# Altium schematic sheet power.SchDoc
size A4; SheetNumber: 3; SheetTotal: 15
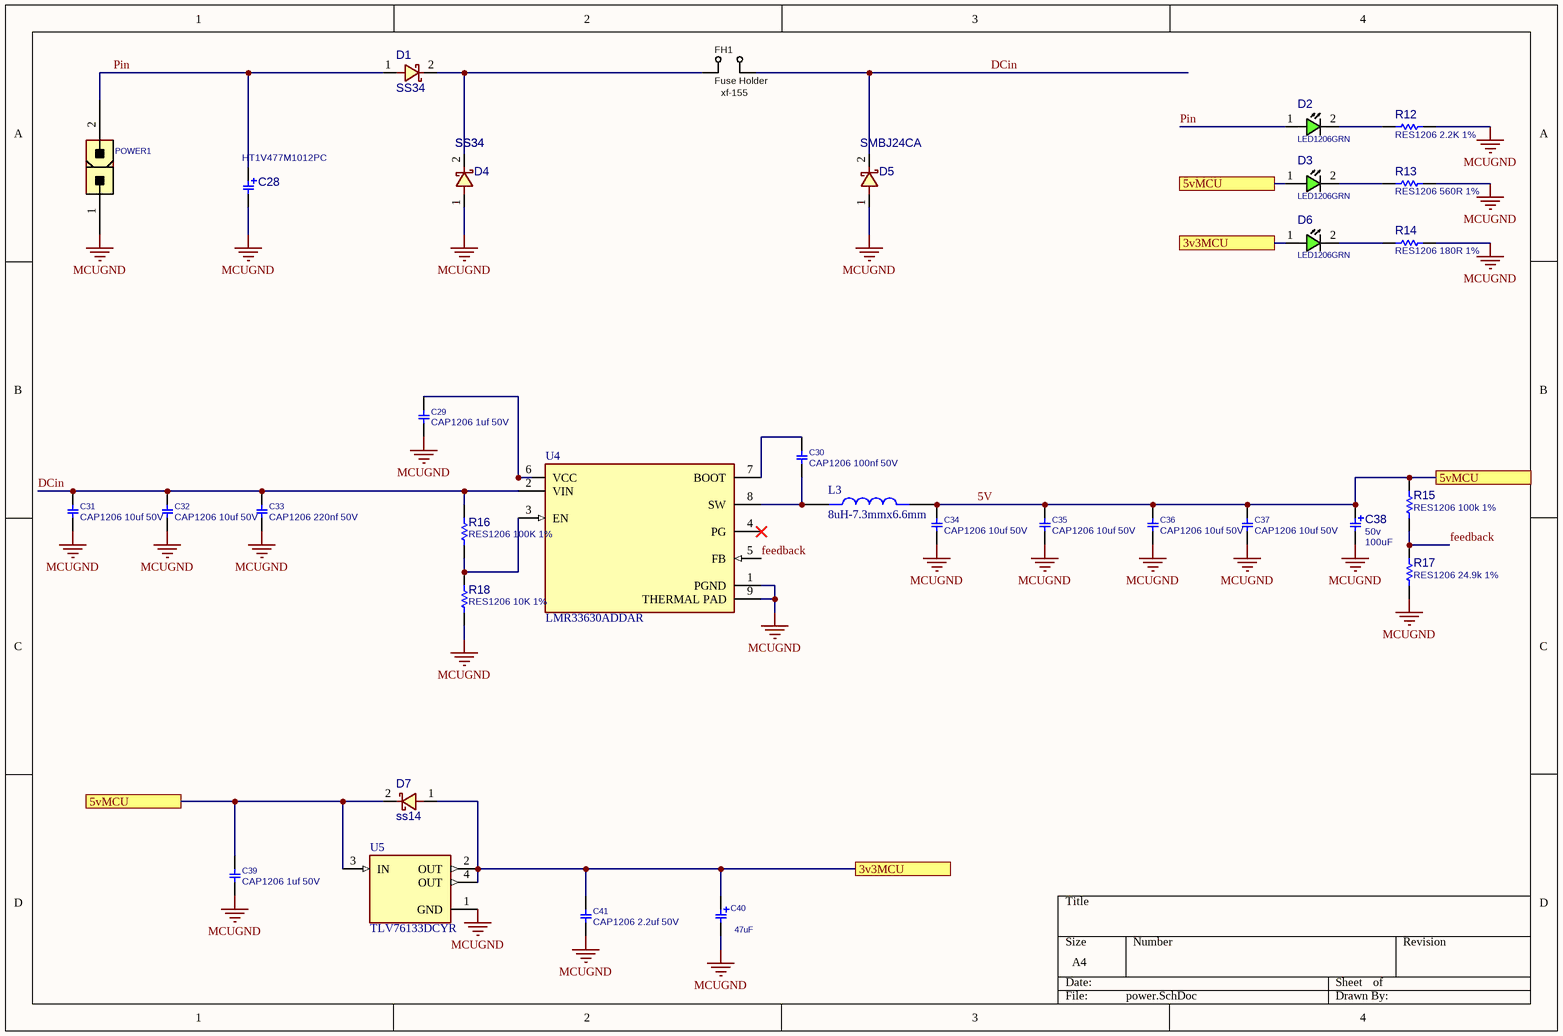
[diagram p0: power.SchDoc]

## Parts
C28  HT1V477M1012PC  [C_EL_10X16]
C29  CAP1206 1uf 50V  [C1206]
C30  CAP1206 100nf 50V  [C1206]
C31  CAP1206 10uf 50V  [C1206]
C32  CAP1206 10uf 50V  [C1206]
C33  CAP1206 220nf 50V  [C1206]
C34  CAP1206 10uf 50V  [C1206]
C35  CAP1206 10uf 50V  [C1206]
C36  CAP1206 10uf 50V  [C1206]
C37  CAP1206 10uf 50V  [C1206]
C38  PARAM2: 50v  [C_EL_8X12]  (hidden comment: 100uF)
C39  CAP1206 1uf 50V  [C1206]
C40  47uF  [C_TN_3528]
C41  CAP1206 2.2uf 50V  [C1206]
D1  SS34  [D_SMB]
D2  LED1206GRN  [LED1206GRN]
D3  LED1206GRN  [LED1206GRN]
D4  SS34  [D_SMB]
D5  SMBJ24CA  [D_SMB]
D6  LED1206GRN  [LED1206GRN]
D7  ss14  [D_SMA]
FH1  xf-155  value Fuse Holder  [FH_24101812]
L3  8uH-7.3mmx6.6mm  [IND_AMPLA7050S-100MT]
POWER1  CONN_ATXPWR_2  [ATXPWR_2]  (value not drawn)
R12  RES1206 2.2K 1%  [R1206]
R13  RES1206 560R 1%  [R1206]
R14  RES1206 180R 1%  [R1206]
R15  RES1206 100k 1%  [R1206]
R16  RES1206 100K 1%  [R1206]
R17  RES1206 24.9k 1%  [R1206]
R18  RES1206 10K 1%  [R1206]
U4  LMR33630ADDAR  [FP-DDA0008J-IPC_C]
U5  TLV76133DCYR  [VREG_TLV76133DCYR]

## Ports
3v3MCU, 5vMCU

## Nets
MCUGND: C28.2 C29.2 C31.2 C32.2 C33.2 C34.2 C35.2 C36.2 C37.2 C38.2 C39.2 C40.2 C41.2 D4.1 D5.1 POWER1.1 R12.1 R13.1 R14.1 R17.1 R18.2 U4.1(PGND) U4.9(THERMAL_PAD) U5.1(GND)
3v3MCU: C40.1 C41.1 D6.1(ANODE) D7.1 U5.2(OUT) U5.4(OUT) ; port 3v3MCU
5V: C34.1 C35.1 C36.1 C37.1 C38.1 C39.1 D3.1(ANODE) D7.2 L3.2 R15.2 U5.3(IN) ; port 5vMCU
DCin: C31.1 C32.1 C33.1 D5.2 FH1.2 R16.1 U4.2(VIN)
feedback: R15.1 R17.2 U4.5(FB)
Pin: C28.1 D1.1 D2.1(ANODE) POWER1.2
NetC29_1: C29.1 U4.6(VCC)
NetC30_1: C30.1 U4.7(BOOT)
NetC30_2: C30.2 L3.1 U4.8(SW)
NetD1_2: D1.2 D4.2 FH1.1
NetD2_2: D2.2(CATHODE) R12.2
NetD3_2: D3.2(CATHODE) R13.2
NetD6_2: D6.2(CATHODE) R14.2
NetR16_2: R16.2 R18.1 U4.3(EN)

Not connected (* = marked no-connect by the designer): U4 4(PG)*

## Library data of the parts
C28 = CAP_THD_EL_470uF_35v: CAP, THD, ELEC,; MANF_P#: MANF_PART#; DESC: DESCRIPTION; DIST#: MOUSER; PARAM: 20%; PARAM2: 35v; VALUE: 470uF; PRICE: 10= -$; MANF: MANF; ASSEMBLY: ASSEMBLY
C29-C37 C39 C41 = CAP_SMD_MLCC_1206: CAP, MLCC; PARAM: -, -%; MANF_P#: MANF_PART#; PARAM2: -V; PRICE: 100= 1$; MANF: -; ASSEMBLY: ASSEMBLY
C38 = CAP_THD_EL_100uF_50v: CAP, THD, ELEC,; MANF_P#: MANF_PART#; DESC: DESCRIPTION; DIST#: MOUSER; PARAM: 20%; PRICE: 10= -$; MANF: MANF; ASSEMBLY: ASSEMBLY; VALUE: 100uF
C40 = CAP_SMD_TAN: CAP, SMD, TAN; PARAM: 20%, 300mOhm, -55~105oC; MANF: VISHAY; MANF_P#: T55A106M6R3C0300; PARAM2: 6.3V; PRICE: 0.46$; VALUE: 47uF
D1 D4 = DIODE_SMD_SCHOTTKY_SS34: DIODE, SCHOTTKY, 20V, 3A; MANF: VISHAY; DESC: DESCRIPTION; ASSEMBLY: ASSEMBLY; PRICE: PRICE; PARAM2: 3A; PARAM: 20V; VALUE: SS34
  D4: MANF_P#: SS34
D2 D3 D6 = LED_SMD_1206_GRN: LED, SMD, 1206, GREEN; PARAM: 20mA; DESC: DESCRIPTION; PARAM2: 2.2V; MANF: -; ASSEMBLY: ASSEMBLY; PRICE: 36t@Javan; MANF_P#: -; VALUE: LED1206GRN; MountType: SMT; PartType: LED
D5 = DIODE_SMD_SCHOTTKY_SS34: DIODE,TVS, 24V, 15A; MANF: VISHAY; MANF_P#: SS34; DESC: DESCRIPTION; PARAM2: 3A; PARAM: 20V; ASSEMBLY: ASSEMBLY; PRICE: PRICE; VALUE: SMBJ24CA
D7 = DIODE_SMD_SCHOTTKY_B345A: DIODE, SCHOTTKY, 40V, 3A; MANF: DIODES; MANF_P#: B345AE-13; DESC: DESCRIPTION; PARAM2: 45Vrrm, 0.45Vf; PARAM: 3A, -50~150oC; ASSEMBLY: ASSEMBLY; PRICE: 0.35$; VALUE: ss14
FH1 = FUSE_SMD_HOLDER_24101812: Fuse SMD2410 Holder; PARAM: max. 10A; MANF: Littelfuse; MANF_P#: 01550900M; PARAM2: 125v; PRICE: 0.2$; PACKAGE: SMD,5.0x9.7mm
L3 = AMPLA7050S-100MT: Inductor Power Shielded/Molded Wirewound 10uH 20% 100KHz Carbonyl Powder 4A 0.069Ohm DCR T/R; MF: Abracon Corporation; SnapEDA_Link: https://www.snapeda.com/parts/AMPLA7050S-100MT/Abracon/view-part/?ref=snap; Purchase-URL: https://pricing.snapeda.com/search/part/AMPLA7050S-100MT/?ref=eda; Package: Package; MP: AMPLA7050S-100MT; Price: None; Availability: In Stock; Check_prices: https://www.snapeda.com/parts/AMPLA7050S-100MT/Abracon/view-part/?ref=eda; Value: *
POWER1 = CONN_ATXPWR_2: CONN, ATX POWER, 2 P; MANF: Molex; MANF_P#: 39281023; VALUE: CONN_ATXPWR_2; MountType: THD; PACKAGE: ATXPWR-2pin; Part Type: Conn.
R12-R18 = RES_SMD_1206: RESISTOR, SMD; PARAM: 1%, 0.25W; DESC: DESCRIPTION; DIST#: MOUSER; MANF_P#: -; MANF: -; ASSEMBLY: ASSEMBLY; PRICE: -; PARAM2: -
U4 = CMP-04918-000184-1: IC REG BUCK ADJUSTABLE 3A 8SOPWR; Switching Frequency: 400kHz; Number of Outputs: 1; Output Configuration: Positive; Synchronous Rectifier: Yes; Min Output Voltage: 1V; Max Output Voltage: 24V; Max Input Voltage: 36V; Min Input Voltage: 3.8V; Output Current: 3A; Min Operating Temperature: -40°C; Max Operating Temperature: 125°C; Number of Pins: 8; RoHS Compliant: Yes; Mount: Surface Mount; Output Type: Adjustable; Packaging: Cut Tape
U5 = TLV76133DCYR: 1-A 16-V high-PSRR linear voltage regulator; MF: Texas Instruments; SnapEDA_Link: https://www.snapeda.com/parts/TLV76133DCYR/Texas+Instruments/view-part/?ref=snap; Package: SOT-223-4 Texas Instruments; Value: *; MP: TLV76133DCYR; Check_prices: https://www.snapeda.com/parts/TLV76133DCYR/Texas+Instruments/view-part/?ref=eda